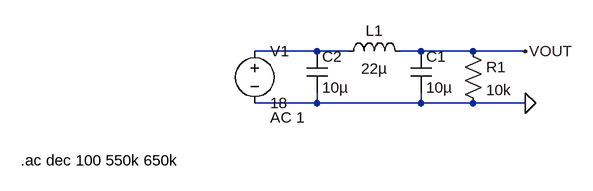
[diagram p0: schematic Draft2.asc]
Draft2.asc, the LTspice schematic file:
Version 4
SHEET 1 1052 680
WIRE 656 304 560 304
WIRE 704 304 656 304
WIRE 816 304 784 304
WIRE 896 304 816 304
WIRE 976 304 896 304
WIRE 656 384 656 368
WIRE 656 384 560 384
WIRE 816 384 816 368
WIRE 816 384 656 384
WIRE 896 384 816 384
WIRE 976 384 896 384
FLAG 976 384 0
FLAG 976 304 VOUT
SYMBOL Res 880 288 R0
SYMATTR InstName R1
SYMATTR Value 10k
SYMBOL ind 688 320 R270
WINDOW 0 32 56 VTop 2
WINDOW 3 5 56 VBottom 2
SYMATTR InstName L1
SYMATTR Value 22µ
SYMATTR SpiceLine Ipk=1.6 Rser=96m Rpar=5.17K Cpar=0 mfg="Bourns, Inc." pn="SRR6038-220Y"
SYMBOL Cap 800 304 R0
SYMATTR InstName C1
SYMATTR Value 10µ
SYMATTR SpiceLine Rser=0.5
SYMBOL Cap 640 304 R0
SYMATTR InstName C2
SYMATTR Value 10µ
SYMATTR SpiceLine Rser=0.05
SYMBOL Voltage 560 288 R0
WINDOW 123 24 118 Left 2
SYMATTR InstName V1
SYMATTR Value 18
SYMATTR Value2 AC 1
SYMATTR SpiceLine Rser=0
TEXT 200 472 Left 2 !.ac dec 100 550k 650k

The netlist it stands for:
* Draft2.asc
R1 VOUT 0 10k
L1 N001 VOUT 22µ Ipk=1.6 Rser=96m Rpar=5.17K Cpar=0 mfg="Bourns, Inc." pn="SRR6038-220Y"
C1 VOUT 0 10µ Rser=0.5
C2 N001 0 10µ Rser=0.05
V1 N001 0 18 AC 1 Rser=0
.ac dec 100 550k 650k
.backanno
.end